# EasyEDA Pro project 物联网底板.eprj, board PCB5
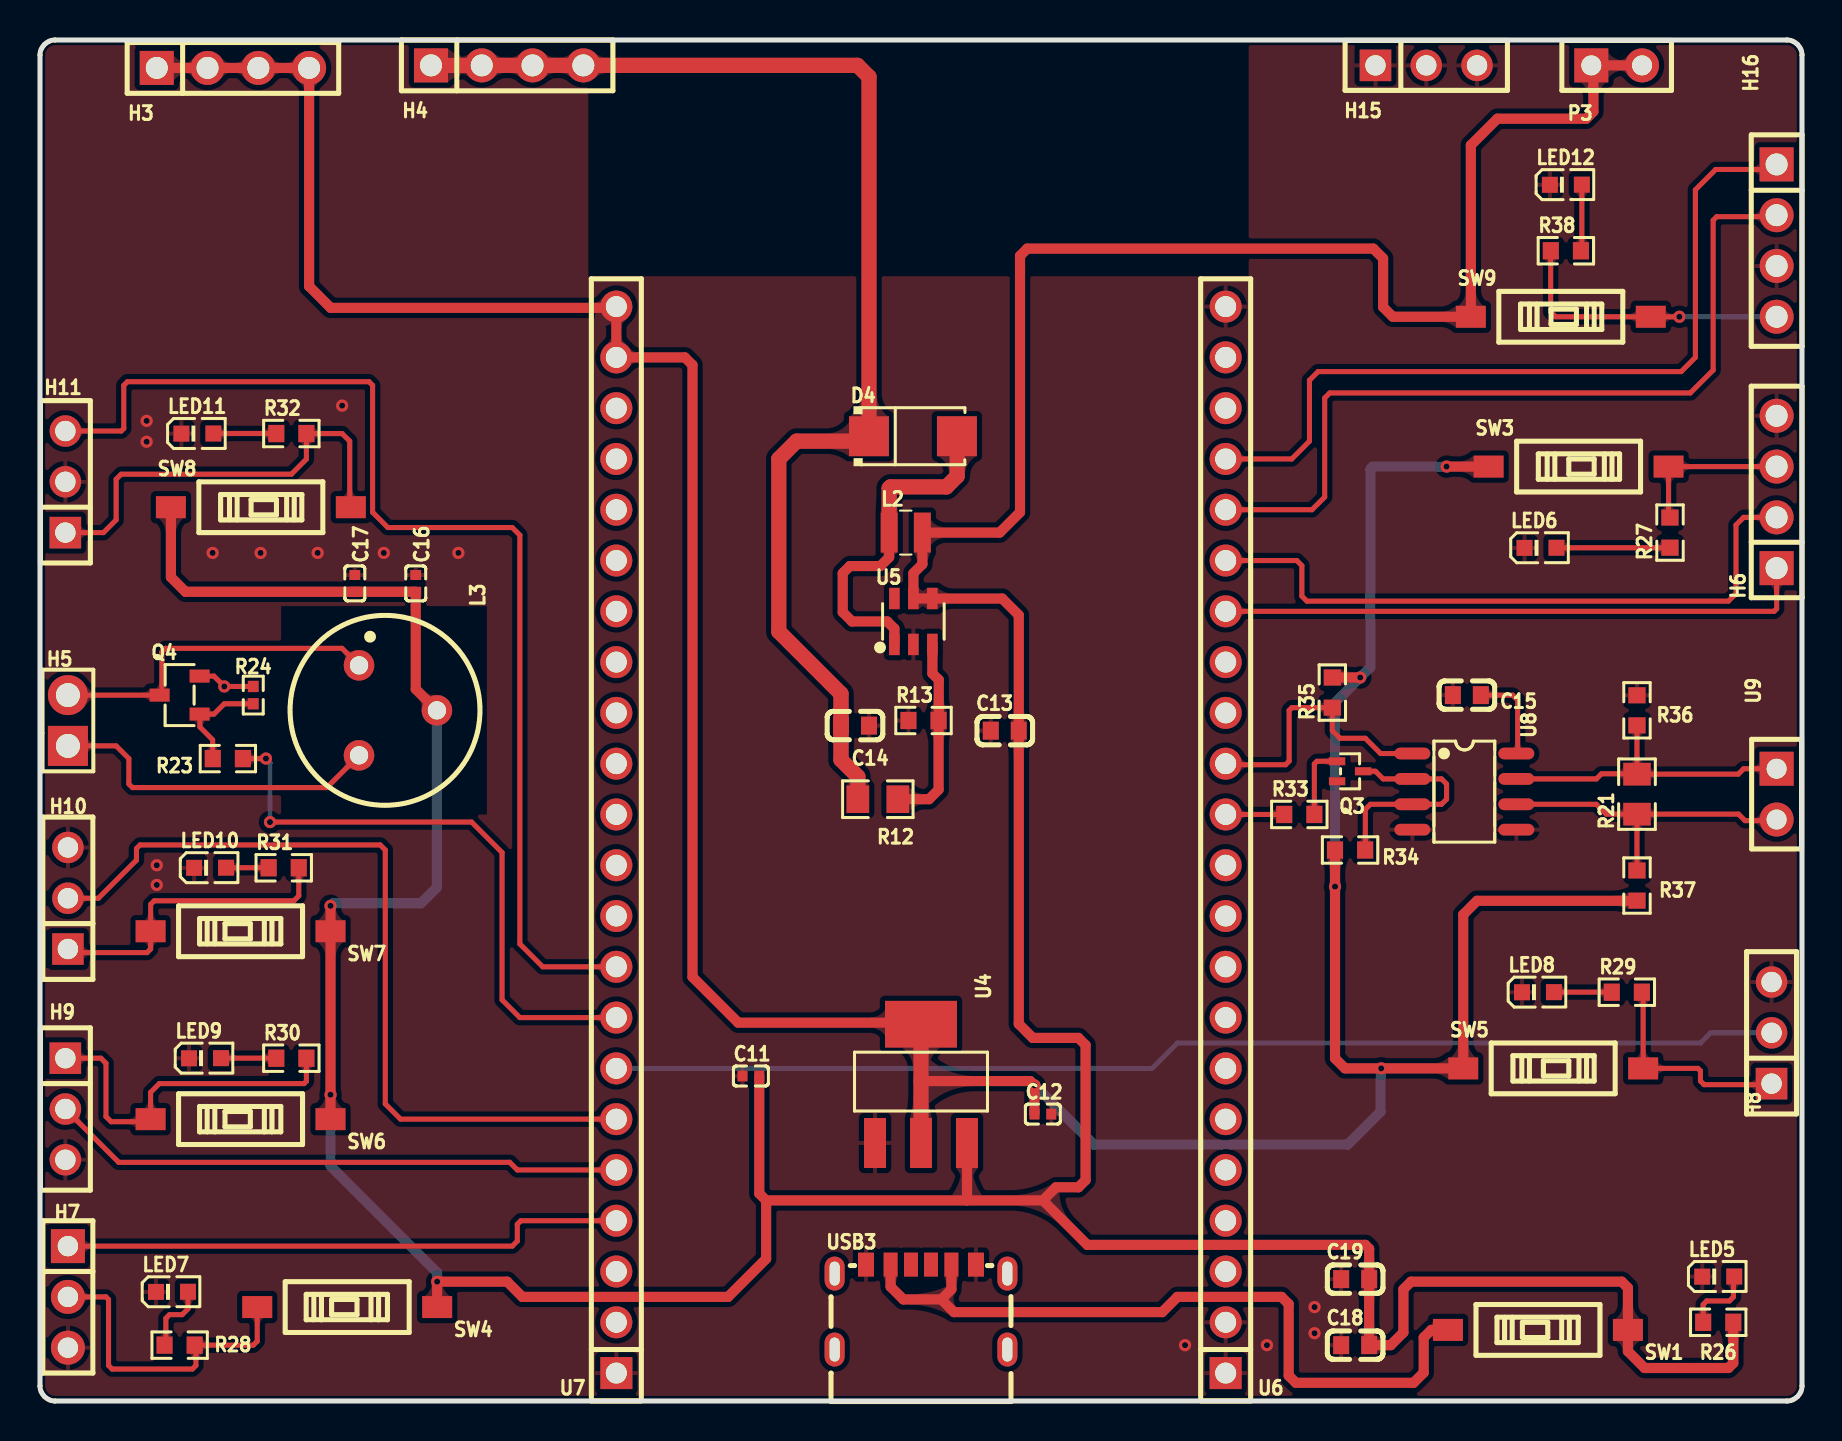
[diagram p6: board, top side]
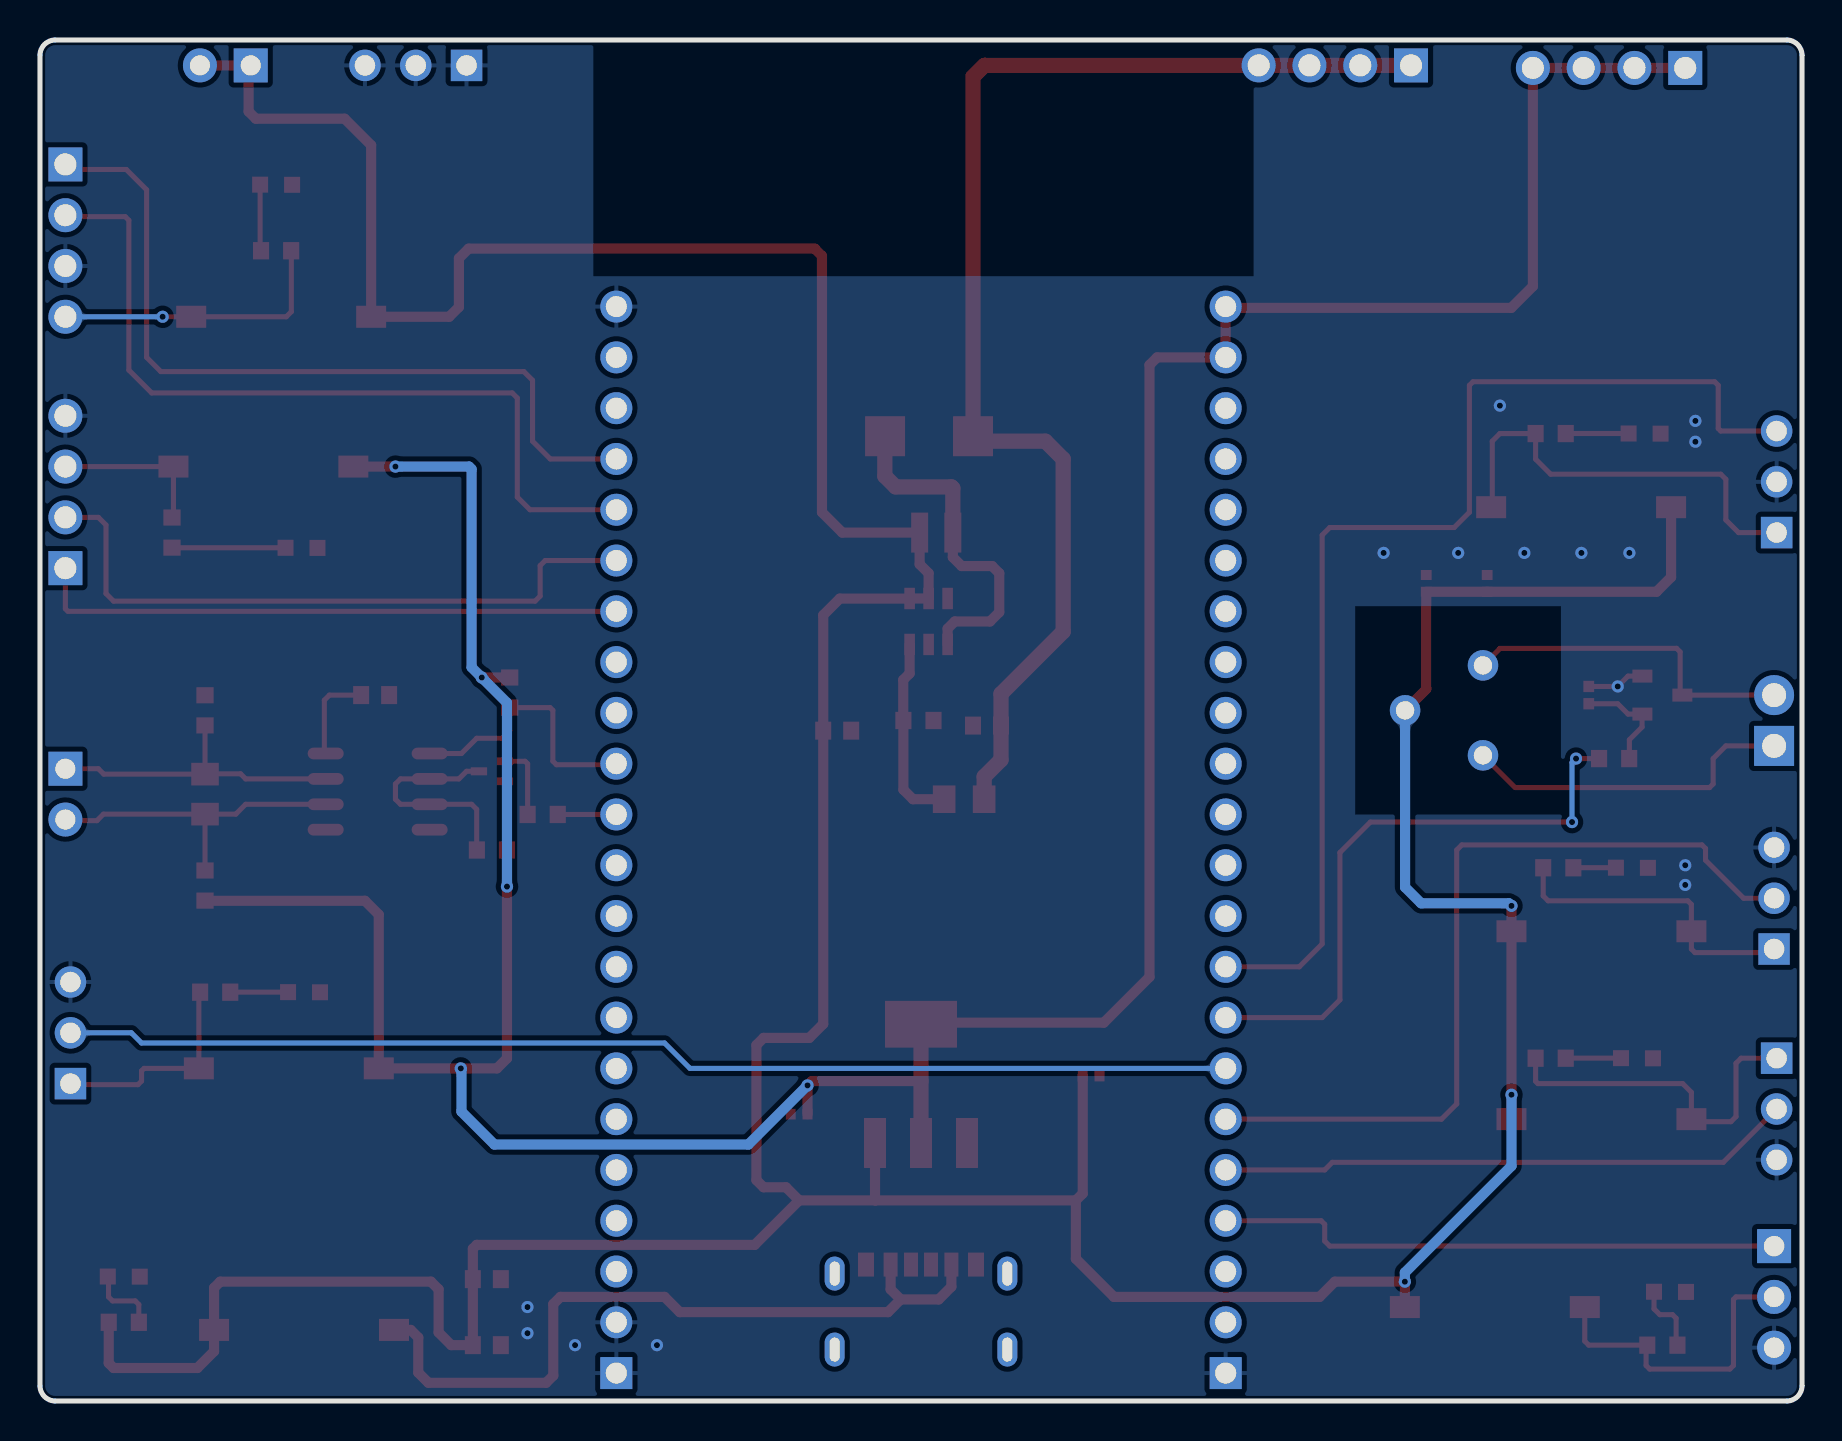
[diagram p7: board, bottom side, seen from below]

Outline 88.14 x 68.07 mm; copper layers: Top Layer, Bottom Layer. Coordinates in mm from the lower left corner of the outline.
Outline path: 0,67.31 0,0.76 arc(0.22,0.22) 0.76,0 87.38,0 arc(87.91,0.22) 88.14,0.76 88.14,67.31 arc(87.91,67.85) 87.38,68.07 0.76,68.07 arc(0.22,67.85) 0,67.31
Stack: Top Layer 0.035mm / Dielectric1 1.51mm FR4 er 4.5 / Bottom Layer 0.035mm

## Design rules (mm)
template: JLCPCB Capability(Two Layers Board)
spacing copperThickness1oz (default): track to track 0.102, other pairs 0.152 to 0.3
spacing copperThickness2oz: track to track 0.203, other pairs 0.152 to 0.3
track width copperThickness1oz (default): min 0.127, default 0.254, max 2.54
track width copperThickness2oz: min 0.203, default 0.254, max 2.54
differential pair differentialPair (default): width min 0.127, default 0.254, max 2.54; gap min 0.152, default 0.152
via viaSize (default): diameter min 0.5, default 0.61, max 10; hole min 0.3, default 0.305, max 6.3

## Placement (name value [footprint] x y rotation side)
C11  10uF  [C0402]  35.56 16.26 0 top
C12  10uF  [C0402]  50.17 14.35 0 top
C13  22uF  [C0603]  48.26 33.53 0 top
C14  22uF  [C0603]  40.77 33.78 180 top
C15  100nF  [C0603]  71.37 35.31 180 top
C16  10uF  [C0402]  18.8 40.89 270 top
C17  100nF  [C0402]  15.75 40.89 270 top
C18  100nF  [C0603]  65.79 2.79 0 top
C19  22uF  [C0603]  65.79 6.1 0 top
D4  SS34  [SMA_L4.3-W2.6-LS5.2-RD]  43.67 48.25 0 top
H3  2.54-1*4P母  [HDR-TH_4P-P2.54-V-F]  9.65 66.68 0 top
H4  2.54-1*4P母  [HDR-TH_4P-P2.54-V-F]  23.37 66.8 0 top
H5  PZ254V-11-02P  [HDR-TH_2P-P2.54-V-M]  1.4 34.04 90 top
H6  OLED  [HDR-TH_4P-P2.54-V-F]  86.87 45.47 90 top
H7  舵机  [HDR-TH_3P-P2.54-V-M_PZ254V-11-03P]  1.4 5.21 270 top
H8  蜂鸣器  [HDR-TH_3P-P2.54-V-F]  86.61 18.42 90 top
H9  DHT11  [HDR-TH_3P-P2.54-V-F]  1.27 14.61 270 top
H10  红外  [HDR-TH_3P-P2.54-V-F]  1.4 25.15 90 top
H11  风扇  [HDR-TH_3P-P2.54-V-F]  1.27 45.97 90 top
H15  PM254V-11-03-H85  [HDR-TH_3P-P2.54-V-F]  69.34 66.8 0 top
H16  rain  [HDR-TH_4P-P2.54-V-F]  86.87 58.04 270 top
L2  4.7uH  [IND-SMD_L2.5-W2.0-VLS252012CX-150M]  43.31 43.43 0 top
L3  30uH  [IND-TH_3P-BD9.5_XR8X10-300K-152K-L]  17.91 34.54 270 top
LED5  XL-1608UGC-04  [LED0603-RD_GREEN]  83.95 6.22 0 top
LED6  XL-1608UGC-04  [LED0603-RD_GREEN]  75.06 42.67 0 top
LED7  XL-1608UGC-04  [LED0603-RD_GREEN]  6.6 5.46 0 top
LED8  XL-1608UGC-04  [LED0603-RD_GREEN]  74.93 20.45 0 top
LED9  XL-1608UGC-04  [LED0603-RD_GREEN]  8.26 17.15 0 top
LED10  XL-1608UGC-04  [LED0603-RD_GREEN]  8.51 26.67 0 top
LED11  XL-1608UGC-04  [LED0603-RD_GREEN]  7.87 48.39 0 top
LED12  XL-1608UGC-04  [LED0603-RD_GREEN]  76.33 60.83 0 top
P3  2.54-1*2P母  [HDR-TH_2P-P2.54-V-F]  78.87 66.8 0 top
Q3  MMBT3904TT1G  [SC-75-3_L1.6-W0.8-P1.00-LS1.6-BR]  65.53 31.5 180 top
Q4  AO3400A  [SOT-23-3_L2.9-W1.3-P1.90-LS2.4-BR]  6.98 35.31 0 top
R12  19kΩ  [R0805]  41.91 30.1 180 top
R13  1kΩ  [R0603]  44.2 34.04 0 top
R21  120Ω  [R0805]  79.88 30.35 90 top
R23  1kΩ  [R0603]  9.4 32.13 180 top
R24  10kΩ  [R0402]  10.67 35.31 270 top
R26  1kΩ  [R0603]  83.95 3.94 0 top
R27  1kΩ  [R0603]  81.53 43.43 90 top
R28  1kΩ  [R0603]  6.98 2.79 0 top
R29  1kΩ  [R0603]  79.38 20.45 0 top
R30  1kΩ  [R0603]  12.57 17.15 0 top
R31  1kΩ  [R0603]  12.19 26.67 0 top
R32  1kΩ  [R0603]  12.57 48.39 0 top
R33  4.7kΩ  [R0603]  62.99 29.34 0 top
R34  4.7kΩ  [R0603]  65.53 27.56 180 top
R35  4.7kΩ  [R0603]  64.64 35.43 90 top
R36  4.7kΩ  [R0603]  79.88 34.54 90 top
R37  4.7kΩ  [R0603]  79.88 25.78 90 top
R38  1kΩ  [R0603]  76.33 57.53 0 top
SW1  DSIC01LS-P  [SW-SMD_2P-L3.5-W6.1-P2.54-LS9.8]  74.93 3.56 180 top
SW3  DSIC01LS-P  [SW-SMD_2P-L3.5-W6.1-P2.54-LS9.8]  76.96 46.74 0 top
SW4  DSIC01LS-P  [SW-SMD_2P-L3.5-W6.1-P2.54-LS9.8]  15.37 4.7 180 top
SW5  DSIC01LS-P  [SW-SMD_2P-L3.5-W6.1-P2.54-LS9.8]  75.69 16.64 0 top
SW6  DSIC01LS-P  [SW-SMD_2P-L3.5-W6.1-P2.54-LS9.8]  10.03 14.1 180 top
SW7  DSIC01LS-P  [SW-SMD_2P-L3.5-W6.1-P2.54-LS9.8]  10.03 23.5 180 top
SW8  DSIC01LS-P  [SW-SMD_2P-L3.5-W6.1-P2.54-LS9.8]  11.05 44.7 0 top
SW9  DSIC01LS-P  [SW-SMD_2P-L3.5-W6.1-P2.54-LS9.8]  76.07 54.23 0 top
U4  AMS1117-3.3  [SOT-223-3_L6.5-W3.4-P2.30-LS7.0-BR]  44.07 15.88 270 top
U5  MT3608  [SOT-23-6_L2.9-W1.6-P0.95-LS2.8-BL]  43.69 38.99 0 top
U6  ZX-PM2.54-1-22PY  [HDR-TH_22P-P2.54-V-F]  59.31 28.07 90 top
U7  ZX-PM2.54-1-22PY  [HDR-TH_22P-P2.54-V-F]  28.83 28.07 90 top
U8  MAX3485EESA+T  [SOIC-8_L4.9-W3.9-P1.27-LS6.0-BL]  71.25 30.48 270 top
U9  LAIL-PM2.54-2P-L  [HDR-TH_2P-P2.54-V-F]  86.87 30.35 270 top
USB3  TYPE-C 6P(073)  [TYPE-C-SMD_TYPE-C-6P-073]  44.07 4.7 0 top

## Footprints (pads in the part's own frame, mm; a bottom-side part is the same pattern mirrored in y, then rotated)
C0402
  rect 0.5x0.54 smd: 1(-0.42,0) 2(0.42,0)
C0603
  rect 0.8x0.9 smd: 1(-0.7,0) 2(0.7,0)
HDR-TH_2P-P2.54-V-F
  rect 1.7x1.7 hole 1: 1(-1.27,0)
  round 1.7 hole 1: 2(1.27,0)
HDR-TH_2P-P2.54-V-M
  rect 2x2 hole 1.2: 1(-1.27,0)
  round 2 hole 1.2: 2(1.27,0)
HDR-TH_3P-P2.54-V-F
  rect 1.575x1.575 hole 1.02: 1(-2.54,0)
  round 1.575 hole 1.02: 2(0,0) 3(2.54,0)
HDR-TH_3P-P2.54-V-M_PZ254V-11-03P
  rect 1.7x1.7 hole 1.02: 1(-2.54,0)
  round 1.7 hole 1.02: 2(0,0) 3(2.54,0)
HDR-TH_4P-P2.54-V-F
  rect 1.7x1.7 hole 1.1: 1(-3.81,0)
  round 1.7 hole 1.1: 2(-1.27,0) 3(1.27,0) 4(3.81,0)
HDR-TH_22P-P2.54-V-F
  rect 1.6x1.6 hole 1.05: 1(-26.67,0)
  round 1.6 hole 1.05: 2(-24.13,0) 3(-21.59,0) 4(-19.05,0) 5(-16.51,0) 6(-13.97,0) 7(-11.43,0) 8(-8.89,0) 9(-6.35,0) 10(-3.81,0) 11(-1.27,0) 12(1.27,0) 13(3.81,0) 14(6.35,0) 15(8.89,0) 16(11.43,0) 17(13.97,0) 18(16.51,0) 19(19.05,0) 20(21.59,0) 21(24.13,0) 22(26.67,0)
IND-SMD_L2.5-W2.0-VLS252012CX-150M
  rect 0.85x2 smd: 1(-0.83,0) 2(0.83,0)
IND-TH_3P-BD9.5_XR8X10-300K-152K-L
  round 1.524 hole 0.914: 1(-2.25,-1.948) 2(0,1.948) 3(2.25,-1.948)
LED0603-RD_GREEN
  rect 0.8x0.8 smd: 1(-0.799,-0.004) 2(0.799,0.004)
R0402
  rect 0.566x0.54 smd: 1(-0.433,0) 2(0.433,0)
R0603
  rect 0.806x0.864 smd: 1(-0.753,0) 2(0.753,0)
R0805
  rect 1.133x1.377 smd: 1(-1,0) 2(1,0)
SC-75-3_L1.6-W0.8-P1.00-LS1.6-BR
  rect 0.816x0.4 smd: 1(0.65,-0.5) 2(0.65,0.5) 3(-0.65,0)
SMA_L4.3-W2.6-LS5.2-RD
  rect 2x2 smd: 1(-2.2,0) 2(2.2,0)
SOIC-8_L4.9-W3.9-P1.27-LS6.0-BL
  oval 0.588x1.8 smd: 1(-1.905,-2.6) 2(-0.635,-2.6) 3(0.635,-2.6) 4(1.905,-2.6) 5(1.905,2.6) 6(0.635,2.6) 7(-0.635,2.6) 8(-1.905,2.6)
SOT-23-3_L2.9-W1.3-P1.90-LS2.4-BR
  rect 1x0.65 smd: 1(1,-0.95) 2(1,0.95) 3(-1,0)
SOT-23-6_L2.9-W1.6-P0.95-LS2.8-BL
  rect 0.532x1.072 smd: 1(-0.95,-1.149) 2(0,-1.149) 3(0.95,-1.149) 4(0.95,1.149) 5(0,1.149) 6(-0.95,1.149)
SOT-223-3_L6.5-W3.4-P2.30-LS7.0-BR
  rect 2.5x1.1 smd: 1(2.97,-2.3) 2(2.97,0) 3(2.97,2.3)
  rect 2.34x3.6 smd: 4(-2.97,0)
SW-SMD_2P-L3.5-W6.1-P2.54-LS9.8
  rect 1.5x1.1 smd: 1(-4.5,0) 2(4.5,0)
TYPE-C-SMD_TYPE-C-6P-073
  oval 1x1.7 hole 0.5x1.2: 7(-4.32,1.675) 7(-4.32,-2.125) 7(4.32,1.675) 7(4.32,-2.125)
  rect 0.7x1.2 smd: A5(-0.5,2.125) A9(1.52,2.125) B5(0.5,2.125) B9(-1.52,2.125)
  rect 0.8x1.2 smd: A12(2.75,2.125) B12(-2.75,2.125)

## Nets
As in the schematic.

Pads without a net: U5 6; USB3 7 A5 B5

## Via types
v1: diameter 0.61, hole 0.305, Top Layer to Bottom Layer, 26 vias

## Routing (per net, layer and track width the routed paths; a pad name or vN(x,y) marks a point on that pad's centre or on a via; arc(x,y) is an arc through that point)
3.3V: length 181.1
  Top Layer w0.508: R35.2 v1(66.04,36.19) ; U4.4 43.99,18.92 34.92,18.92 32.64,21.21 32.64,51.82 32.26,52.2 U7.21 U7.22 28.77,54.67 14.54,54.67 13.46,55.75 H3.4 H3.3 H3.2 H3.1 ; C12.1 v1(49.74,15.79) 49.53,16 44.07,16 44.07,16 ; SW3.1 v1(70.36,46.74) ; R34.2 v1(64.78,25.73) 64.78,17.14 65.28,16.64 v1(67.09,16.64) SW5.1 71.19,24.33 71.88,25.02 79.87,25.02 R37.1
  Top Layer w0.762: U4.4 U4.2
  Bottom Layer w0.508: v1(70.36,46.74) 66.67,46.74 66.55,46.61 66.55,36.69 v1(66.04,36.19) 64.78,34.93 v1(64.78,25.73) ; v1(49.74,15.79) 52.7,12.83 65.41,12.83 67.06,14.48 67.06,16.61 v1(67.09,16.64)
12V: length 63.8
  Top Layer w0.762: H4.1 H4.2 H4.4 40.89,66.8 41.47,66.23 D4.1 41.22,48.01 37.85,48.01 36.96,47.12 36.96,38.48 40.07,35.37 C14.2 40.07,32.07 40.91,31.23 R12.2
+5V: length 259.3
  Top Layer w0.508: L3.2 18.8,35.6 C16.2 ; v1(14.53,24.77) SW7.1 v1(14.53,15.32) SW6.1 ; C11.2 35.98,10.38 36.32,10.03 ; U4.3 46.37,10.05 46.36,10.03 ; SW8.1 6.55,41.2 7.28,40.47 C17.2 18.71,40.47 ; 36.32,10.03 46.36,10.03 ; 36.32,10.03 36.32,7.11 34.42,5.21 24.13,5.21 23.37,5.97 v1(19.87,5.97) SW4.1 ; 46.36,10.03 50.17,10.03 ; 50.17,10.03 50.82,10.69 51.94,10.69 52.3,11.05 52.3,17.8 51.94,18.16 49.66,18.16 48.96,18.86 C13.2 48.96,39.31 48.13,40.13 44.64,40.13 U5.4 U5.5 43.69,41.4 44.14,41.85 L2.2 48.01,43.43 49.02,44.45 49.02,57.28 49.38,57.64 66.7,57.64 67.18,57.15 67.18,54.72 67.67,54.23 SW9.1 71.57,62.81 72.9,64.14 77.34,64.14 77.7,64.49 77.7,66.7 P3.1 P3.2 ; 50.17,10.03 52.39,7.81 66.29,7.81 66.49,7.62 C19.2 C18.2 67.56,2.79 68.2,3.43 68.2,5.59 68.58,5.97 79.12,5.97 79.43,5.66 SW1.1 79.43,2.49 80.26,1.65 84.45,1.65 84.7,1.9 R26.2
  Bottom Layer w0.508: v1(14.53,24.77) 14.66,24.89 19.05,24.89 19.86,25.7 L3.2 ; v1(14.53,15.32) 14.53,11.76 19.87,6.42 v1(19.87,5.97)
GND: length 2.9
  Top Layer w0.254: R24.1 v1(9.22,35.74) 8.7,36.26 Q4.2
  vias: v1(5.33,49.02) v1(5.33,47.98) v1(5.84,26.8) v1(5.84,25.81) v1(8.64,42.42) v1(11.03,42.42) v1(13.89,42.42) v1(15.11,49.78) v1(17.2,42.42) v1(20.93,42.42) v1(57.28,2.79) v1(61.37,2.79) v1(63.75,4.7) v1(63.75,3.39)
VIN: length 37.8
  Top Layer w0.508: USB3.A9 45.59,5.58 45.08,5.08 ; 45.08,5.08 45.72,4.44 56.13,4.44 56.9,5.21 62.1,5.21 62.46,4.85 62.46,1.27 62.82,0.91 68.71,0.91 69.21,1.42 69.21,3.18 69.6,3.56 SW1.2 ; 45.08,5.08 43.18,5.08 42.55,5.72 USB3.B9
A0_RAIN: length 40.4
  Top Layer w0.254: U6.19 62.61,47.12 63.5,48.01 63.5,51.05 63.93,51.49 82.09,51.49 82.8,52.2 82.8,60.58 83.82,61.6 86.61,61.6 H16.1
BEEP: length 58.5
  Bottom Layer w0.254: H8.2 83.57,18.42 83.06,17.91 56.9,17.91 55.63,16.64 U7.7
DO_RAIN: length 41
  Top Layer w0.254: U6.18 63.63,44.58 64.26,45.21 64.26,50.17 64.52,50.42 82.55,50.42 83.69,51.56 83.69,59.06 83.87,59.23 86.79,59.23 H16.2
FAN_CTL: length 57.7
  Top Layer w0.254: U7.9 25.15,21.72 24,22.86 24,43.31 23.62,43.69 17.4,43.69 16.64,44.45 16.64,50.8 16.46,50.98 4.37,50.98 4.19,50.8 4.19,48.64 4.06,48.51 H11.3
PWM_1: length 28.4
  Top Layer w0.254: U7.4 24.06,9.02 23.88,8.84 23.88,8 23.62,7.75 H7.1
RED_DATA: length 42
  Top Layer w0.254: H10.2 2.92,25.15 4.83,27.05 4.83,27.63 5.01,27.81 17.02,27.81 17.27,27.56 17.27,14.86 18.03,14.1 U7.6
RS485_A: length 16.2
  Top Layer w0.254: R37.2 R21.1 ; R21.1 84.96,29.35 85.29,29.03 86.81,29.03 U9.2 ; R21.1 78.34,29.35 77.85,29.85 U8.6
RS485_B: length 15.7
  Top Layer w0.254: R36.1 R21.2 ; R21.2 79.87,31.37 78.11,31.37 77.85,31.12 U8.7 ; R21.2 84.95,31.35 85.22,31.62 U9.1
RX0: length 13.7
  Top Layer w0.254: U8.1 67.06,32.39 66.29,33.15 65.02,33.15 64.64,33.53 R35.1 62.62,34.68 62.48,34.54 62.48,32 62.3,31.82 59.36,31.82 U6.13
SCK: length 33
  Top Layer w0.254: U6.17 62.86,42.04 63.12,41.78 63.12,40.26 63.37,40.01 84.45,40.01 84.84,40.39 84.84,43.82 85.22,44.2 H6.2
SDA: length 29.6
  Top Layer w0.254: H6.1 86.87,39.62 86.74,39.5 U6.16
TEMP_DATA: length 28.8
  Top Layer w0.254: H9.2 3.94,11.94 23.49,11.94 23.88,11.56 U7.5
TX0: length 2.9
  Top Layer w0.254: R33.1 U6.12
WET: length 30.1
  Top Layer w0.254: R23.1 v1(11.3,32.13) ; v1(11.5,28.96) 21.59,28.96 23.11,27.43 23.11,20.07 24,19.18 U7.8
  Bottom Layer w0.254: v1(11.5,28.96) 11.5,31.93 v1(11.3,32.13)
$1N9036: length 3.6
  Top Layer w0.254: R26.1 83.19,4.83 83.37,5.01 84.51,5.01 84.71,5.21 84.71,6.19 LED5.2
$1N9283: length 17.4
  Top Layer w0.508: U5.1 42.74,38.63 42.38,38.99 40.62,38.99 40.15,39.45 40.15,41.4 40.51,41.76 42.04,41.76 42.48,42.2 L2.1
  Top Layer w0.762: 45.87,48.25 45.88,48.24 45.88,46.26 45.34,45.72 42.55,45.72 42.48,45.65 L2.1
$1N9292: length 9.6
  Top Layer w0.508: U5.3 44.64,36.39 44.96,36.07 44.96,34.04 R13.2 44.95,30.58 44.47,30.1 R12.1
$1N10351: length 8
  Top Layer w0.254: R27.2 81.46,44.26 SW3.2 H6.3
$1N10356: length 5.7
  Top Layer w0.254: LED6.2 81.53,42.68 R27.1
$1N10410: length 3.5
  Top Layer w0.254: R28.1 6.3,2.86 6.3,4.14 6.48,4.32 7.11,4.32 7.4,4.61 LED7.2
$1N10425: length 15.9
  Top Layer w0.254: SW4.2 10.87,2.99 10.67,2.79 R28.2 7.8,2.73 7.8,1.78 7.62,1.6 3.61,1.6 3.43,1.78 3.43,5.08 3.3,5.21 H7.2
$1N10481: length 10.9
  Top Layer w0.254: R29.2 80.19,20.38 SW5.2 82.93,16.64 83.06,16.51 83.06,16 83.24,15.82 86.56,15.82 H8.1
$1N10486: length 2.9
  Top Layer w0.254: LED8.2 78.62,20.45 R29.1
$1N10515: length 2.8
  Top Layer w0.254: R30.1 11.82,17.15 LED9.2
$1N10525: length 17.7
  Top Layer w0.254: R30.2 13.33,15.99 13.21,15.88 5.97,15.88 5.53,15.44 SW6.2 5.41,13.97 3.56,13.97 3.3,14.22 3.3,16.89 3.05,17.15 H9.1
$1N10556: length 2.1
  Top Layer w0.254: R31.1 11.44,26.67 LED10.2
$1N10570: length 15.5
  Top Layer w0.254: R31.2 12.95,25.26 12.7,25.02 5.72,25.02 5.54,24.84 5.54,23.5 SW7.2 5.53,22.61 5.35,22.43 1.58,22.43 1.4,22.61
$1N10629: length 21.7
  Top Layer w0.254: 1.27,43.43 3.17,43.43 3.81,44.07 3.81,46.1 4.06,46.36 12.57,46.36 13.33,47.11 R32.2 15.11,48.39 15.49,48.01 15.49,44.76 SW8.2
$1N10642: length 3.1
  Top Layer w0.254: LED11.2 11.82,48.39 R32.1
$1N10692: length 3.7
  Top Layer w0.254: Q3.1 63.87,32 63.75,31.87 R33.2
$1N10709: length 11.5
  Top Layer w0.254: R34.1 66.29,27.57 66.29,29.59 66.55,29.85 U8.3 70.1,29.85 70.36,30.1 70.36,30.86 70.1,31.12 U8.2 67.18,31.12 66.8,31.5 Q3.3
$1N10944: length 4.6
  Top Layer w0.254: C15.1 73.66,35.31 73.91,35.05 73.91,32.45 U8.8
$1N11282: length 5.4
  Top Layer w0.254: R23.2 8.64,32.14 8.64,33.07 8,33.71 8,34.34 Q4.1 8.7,34.36 9.22,34.87 R24.2
$1N11321: length 16.8
  Top Layer w0.254: H5.1 3.81,32.77 4.45,32.13 4.45,30.86 4.62,30.68 14.35,30.68 L3.3
$1N11329: length 17.1
  Top Layer w0.254: 1.4,35.31 Q4.3 6.1,35.42 6.1,37.47 6.28,37.64 15.11,37.64 L3.1
$1N18758: length 14.5
  Top Layer w0.254: R38.1 75.57,57.52 75.57,54.48 75.82,54.23 SW9.2 v1(82,54.23)
  Bottom Layer w0.254: v1(82,54.23) H16.4
$1N18759: length 3.3
  Top Layer w0.254: LED12.2 77.13,57.58 R38.2

## Copper pours and planes (outline as drawn; the poured copper is in the pictures)
GND on Top Layer: -1.91,71.37 90.68,71.37 90.68,-4.06 -1.91,-4.06
GND on Bottom Layer: -2.29,70.61 89.66,70.61 89.66,-3.68 -2.29,-3.68

Small or netless copper shapes (teardrops, artwork), in the pictures only: 190 on Top Layer, 15 on Bottom Layer
